# Altium project SMBUS-I2C-sensors-proto.PrjPcb
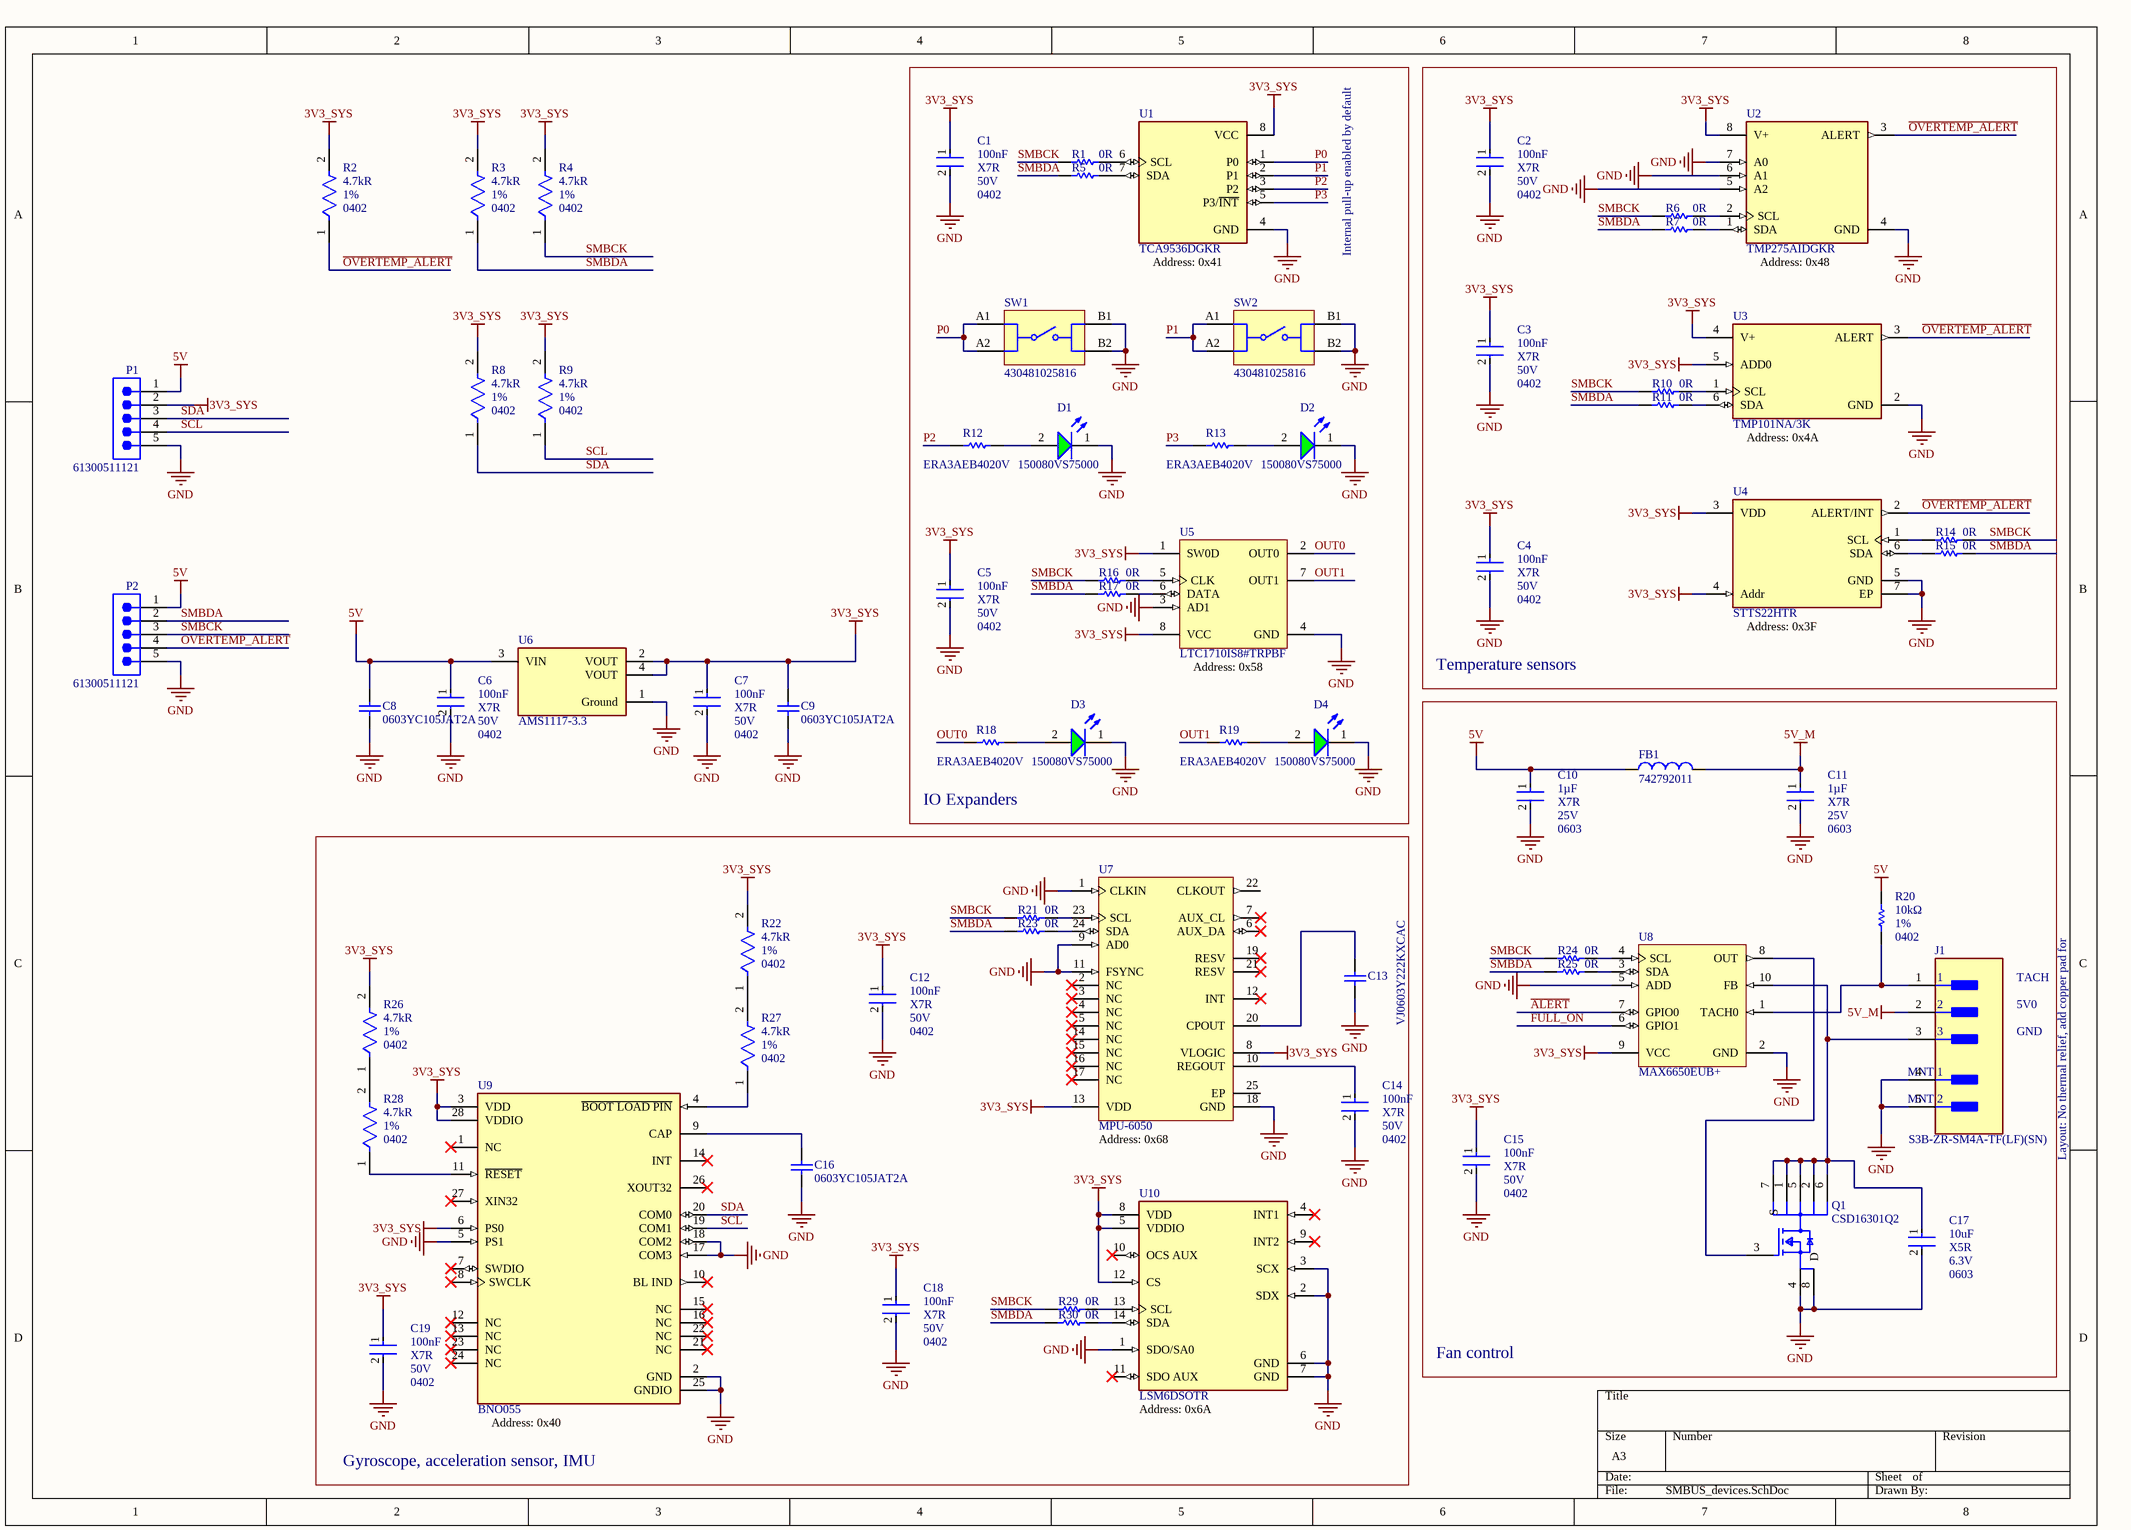
[diagram p0: SMBUS_devices.SchDoc]
1 sheet, 70 parts. Net scope: global (net labels, ports and power ports of the same name join across sheets).
Board file: PCB1.PcbDoc

## Sheet SMBUS_devices.SchDoc
size A3; SheetNumber: 1; SheetTotal: 1

### Parts
C1  Voltage Rating (DC): 50V  Case/Package: 0402  Dielectric: X7R  Capacitance: 100nF  [FP-GRM155-0_05-IPC_B]  (hidden comment: GRM155R71H104KE14D)
C2  Voltage Rating (DC): 50V  Case/Package: 0402  Dielectric: X7R  Capacitance: 100nF  [FP-GRM155-0_05-IPC_B]  (hidden comment: GRM155R71H104KE14D)
C3  Voltage Rating (DC): 50V  Case/Package: 0402  Dielectric: X7R  Capacitance: 100nF  [FP-GRM155-0_05-IPC_B]  (hidden comment: GRM155R71H104KE14D)
C4  Voltage Rating (DC): 50V  Case/Package: 0402  Dielectric: X7R  Capacitance: 100nF  [FP-GRM155-0_05-IPC_B]  (hidden comment: GRM155R71H104KE14D)
C5  Voltage Rating (DC): 50V  Case/Package: 0402  Dielectric: X7R  Capacitance: 100nF  [FP-GRM155-0_05-IPC_B]  (hidden comment: GRM155R71H104KE14D)
C6  Voltage Rating (DC): 50V  Case/Package: 0402  Dielectric: X7R  Capacitance: 100nF  [FP-GRM155-0_05-IPC_B]  (hidden comment: GRM155R71H104KE14D)
C7  Voltage Rating (DC): 50V  Case/Package: 0402  Dielectric: X7R  Capacitance: 100nF  [FP-GRM155-0_05-IPC_B]  (hidden comment: GRM155R71H104KE14D)
C8  0603YC105JAT2A  [CAPC1608X90X35NL15T15]
C9  0603YC105JAT2A  [CAPC1608X90X35NL15T15]
C10  Dielectric: X7R  Capacitance: 1µF  Voltage Rating: 25V  Case/Package: 0603  [FP-GCM188-0_1-MFG]  (hidden comment: GCM188R71E105KA64D)
C11  Dielectric: X7R  Capacitance: 1µF  Voltage Rating: 25V  Case/Package: 0603  [FP-GCM188-0_1-MFG]  (hidden comment: GCM188R71E105KA64D)
C12  Voltage Rating (DC): 50V  Case/Package: 0402  Dielectric: X7R  Capacitance: 100nF  [FP-GRM155-0_05-IPC_B]  (hidden comment: GRM155R71H104KE14D)
C13  VJ0603Y222KXCAC  [CAPC1608X92X38NL15T08]
C14  Voltage Rating (DC): 50V  Case/Package: 0402  Dielectric: X7R  Capacitance: 100nF  [FP-GRM155-0_05-IPC_B]  (hidden comment: GRM155R71H104KE14D)
C15  Voltage Rating (DC): 50V  Case/Package: 0402  Dielectric: X7R  Capacitance: 100nF  [FP-GRM155-0_05-IPC_B]  (hidden comment: GRM155R71H104KE14D)
C16  0603YC105JAT2A  [CAPC1608X90X35NL15T15]
C17  Voltage Rating (DC): 6.3V  Dielectric: X5R  Capacitance: 10uF  Case/Package: 0603  [FP-GRM188-0_1-e0_2_0_55-IPC_A]  (hidden comment: GRM188R60J106ME47D)
C18  Voltage Rating (DC): 50V  Case/Package: 0402  Dielectric: X7R  Capacitance: 100nF  [FP-GRM155-0_05-IPC_B]  (hidden comment: GRM155R71H104KE14D)
C19  Voltage Rating (DC): 50V  Case/Package: 0402  Dielectric: X7R  Capacitance: 100nF  [FP-GRM155-0_05-IPC_B]  (hidden comment: GRM155R71H104KE14D)
D1  150080VS75000  [WL-SMCW_0805_150080xx75000]
D2  150080VS75000  [WL-SMCW_0805_150080xx75000]
D3  150080VS75000  [WL-SMCW_0805_150080xx75000]
D4  150080VS75000  [WL-SMCW_0805_150080xx75000]
FB1  742792011  [WE-CBF_0805_L2W1.2H0.9_HC]
J1  S3B-ZR-SM4A-TF(LF)(SN)  [FP-S3B-ZR-SM4A-TF_LF_SN-MFG]
P1  61300511121  [61300511121]
P2  61300511121  [61300511121]
Q1  CSD16301Q2  [FP-CSD16301Q2-MFG]
R1  value 0R  [RESC1005X40X25NL05T10]  (hidden comment: RC0402JR-100RL)
R2  Case Code (Imperial): 0402  Tolerance: 1%  Resistance: 4.7kR  [FP-CRCW0402-e3-IPC_B]  (hidden comment: CRCW04024K70FKED)
R3  Case Code (Imperial): 0402  Tolerance: 1%  Resistance: 4.7kR  [FP-CRCW0402-e3-IPC_B]  (hidden comment: CRCW04024K70FKED)
R4  Case Code (Imperial): 0402  Tolerance: 1%  Resistance: 4.7kR  [FP-CRCW0402-e3-IPC_B]  (hidden comment: CRCW04024K70FKED)
R5  value 0R  [RESC1005X40X25NL05T10]  (hidden comment: RC0402JR-100RL)
R6  value 0R  [RESC1005X40X25NL05T10]  (hidden comment: RC0402JR-100RL)
R7  value 0R  [RESC1005X40X25NL05T10]  (hidden comment: RC0402JR-100RL)
R8  Case Code (Imperial): 0402  Tolerance: 1%  Resistance: 4.7kR  [FP-CRCW0402-e3-IPC_B]  (hidden comment: CRCW04024K70FKED)
R9  Case Code (Imperial): 0402  Tolerance: 1%  Resistance: 4.7kR  [FP-CRCW0402-e3-IPC_B]  (hidden comment: CRCW04024K70FKED)
R10  value 0R  [RESC1005X40X25NL05T10]  (hidden comment: RC0402JR-100RL)
R11  value 0R  [RESC1005X40X25NL05T10]  (hidden comment: RC0402JR-100RL)
R12  ERA3AEB4020V  [RESC1608X55X30ML20T20]
R13  ERA3AEB4020V  [RESC1608X55X30ML20T20]
R14  value 0R  [RESC1005X40X25NL05T10]  (hidden comment: RC0402JR-100RL)
R15  value 0R  [RESC1005X40X25NL05T10]  (hidden comment: RC0402JR-100RL)
R16  value 0R  [RESC1005X40X25NL05T10]  (hidden comment: RC0402JR-100RL)
R17  value 0R  [RESC1005X40X25NL05T10]  (hidden comment: RC0402JR-100RL)
R18  ERA3AEB4020V  [RESC1608X55X30ML20T20]
R19  ERA3AEB4020V  [RESC1608X55X30ML20T20]
R20  value 10kΩ  Case/Package: 0402  Tolerance: 1%  [RESC1005X40X25LL05T10]  (hidden comment: RC0402FR-0710KL)
R21  value 0R  [RESC1005X40X25NL05T10]  (hidden comment: RC0402JR-100RL)
R22  Case Code (Imperial): 0402  Tolerance: 1%  Resistance: 4.7kR  [FP-CRCW0402-e3-IPC_B]  (hidden comment: CRCW04024K70FKED)
R23  value 0R  [RESC1005X40X25NL05T10]  (hidden comment: RC0402JR-100RL)
R24  value 0R  [RESC1005X40X25NL05T10]  (hidden comment: RC0402JR-100RL)
R25  value 0R  [RESC1005X40X25NL05T10]  (hidden comment: RC0402JR-100RL)
R26  Case Code (Imperial): 0402  Tolerance: 1%  Resistance: 4.7kR  [FP-CRCW0402-e3-IPC_B]  (hidden comment: CRCW04024K70FKED)
R27  Case Code (Imperial): 0402  Tolerance: 1%  Resistance: 4.7kR  [FP-CRCW0402-e3-IPC_B]  (hidden comment: CRCW04024K70FKED)
R28  Case Code (Imperial): 0402  Tolerance: 1%  Resistance: 4.7kR  [FP-CRCW0402-e3-IPC_B]  (hidden comment: CRCW04024K70FKED)
R29  value 0R  [RESC1005X40X25NL05T10]  (hidden comment: RC0402JR-100RL)
R30  value 0R  [RESC1005X40X25NL05T10]  (hidden comment: RC0402JR-100RL)
SW1  430481025816  [430481025816]
SW2  430481025816  [430481025816]
U1  TCA9536DGKR  [SOP65P490X110-8N]
U2  TMP275AIDGKR  [FP-DGK0008A-IPC_C]
U3  TMP101NA/3K  [FP-DBV0006A-IPC_A]
U4  STTS22HTR  [FP-UDFN-6L-DM00423052-MFG]
U5  LTC1710IS8#TRPBF  [LT-S8-8_M]
U6  AMS1117-3.3  [FP-AMS1117-IPC_C]
U7  MPU-6050  [IS-QFN-24_V]
U8  MAX6650EUB+  [MAXM-U10+2_N]
U9  BNO055  [FP-BNO055-MFG]
U10  LSM6DSOTR  [FP-LGA-14L-DM00249496-MFG]

### Blocks framed on the sheet
IO Expanders: C1 C5 D1-D4 R1 R5 R12 R13 R16-R19 SW1 SW2 U1 U5
Temperature sensors: C2-C4 R6 R7 R10 R11 R14 R15 U2-U4
Fan control: C10 C11 C15 C17 FB1 J1 Q1 R20 R24 R25 U8
Gyroscope, acceleration sensor, IMU: C12-C14 C16 C18 C19 R21-R23 R26-R30 U7 U9 U10

### Nets
3V3_SYS: C1.1 C2.1 C3.1 C4.1 C5.1 C7.1 C9.2 C12.1 C15.1 C18.1 C19.1 P1.2 R2.2 R3.2 R4.2 R8.2 R9.2 R22.2 R26.2 U1.8(VCC) U2.8(V+) U3.4(V+) U3.5(ADD0) U4.3(VDD) U4.4(Addr) U5.1(SW0D) U5.8(VCC) U6.2(VOUT) U6.4(VOUT) U7.8(VLOGIC) U7.13(VDD) U8.9(VCC) U9.3(VDD) U9.6(PS0) U9.28(VDDIO) U10.5(VDDIO) U10.8(VDD) U10.12(CS)
5V: C6.1 C8.2 C10.1 FB1.1 P1.1 P2.1 R20.2 U6.3(VIN)
5V_M: C11.1 FB1.2 J1.2
GND: C1.2 C2.2 C3.2 C4.2 C5.2 C6.2 C7.2 C8.1 C9.1 C10.2 C11.2 C12.2 C13.1 C14.2 C15.2 C16.1 C17.2 C18.2 C19.2 D1.1(K) D2.1(K) D3.1(K) D4.1(K) J1.4(MNT_1) J1.5(MNT_2) P1.5 P2.5 Q1.4(S) Q1.8(D) SW1.B1 SW1.B2 SW2.B1 SW2.B2 U1.4(GND) U2.4(GND) U2.5(A2) U2.6(A1) U2.7(A0) U3.2(GND) U4.5(GND) U4.7(EP) U5.3(AD1) U5.4(GND) U6.1(Ground) U7.1(CLKIN) U7.9(AD0) U7.11(FSYNC) U7.18(GND) U8.2(GND) U8.5(ADD) U9.2(GND) U9.5(PS1) U9.17(COM3) U9.18(COM2) U9.25(GNDIO) U10.1(SDO/SA0) U10.2(SDX) U10.3(SCX) U10.6(GND) U10.7(GND)
~{ALERT}: U8.7(GPIO0)
~{FULL_O}N: U8.6(GPIO1)
~{OVERTEMP_ALERT}: P2.4 R2.1 U2.3(ALERT) U3.3(ALERT) U4.2(ALERT/INT)
OUT0: R18.1 U5.2(OUT0)
OUT1: R19.1 U5.7(OUT1)
P0: SW1.A1 SW1.A2 U1.1(P0)
P1: SW2.A1 SW2.A2 U1.2(P1)
P2: R12.1 U1.3(P2)
P3: R13.1 U1.5(P3/~{INT})
SCL: P1.4 R9.1 U9.19(COM1)
SDA: P1.3 R8.1 U9.20(COM0)
SMBCK: P2.3 R1.1 R4.1 R6.1 R10.1 R14.2 R16.1 R21.1 R24.1 R29.1
SMBDA: P2.2 R3.1 R5.1 R7.1 R11.1 R15.2 R17.1 R23.1 R25.1 R30.1
NetC13_2: C13.2 U7.20(CPOUT)
NetC14_1: C14.1 U7.10(REGOUT)
NetC16_2: C16.2 U9.9(CAP)
NetC17_1: C17.1 J1.3 Q1.1(D) Q1.2(D) Q1.5(D) Q1.6(D) Q1.7(S) U8.10(FB)
NetD1_2: D1.2(A) R12.2
NetD2_2: D2.2(A) R13.2
NetD3_2: D3.2(A) R18.2
NetD4_2: D4.2(A) R19.2
NetJ1_1: J1.1 R20.1 U8.1(TACH0)
NetQ1_3: Q1.3(G) U8.8(OUT)
NetR1_2: R1.2 U1.6(SCL)
NetR5_2: R5.2 U1.7(SDA)
NetR6_2: R6.2 U2.2(SCL)
NetR7_2: R7.2 U2.1(SDA)
NetR10_2: R10.2 U3.1(SCL)
NetR11_2: R11.2 U3.6(SDA)
NetR14_1: R14.1 U4.1(SCL)
NetR15_1: R15.1 U4.6(SDA)
NetR16_2: R16.2 U5.5(CLK)
NetR17_2: R17.2 U5.6(DATA)
NetR21_2: R21.2 U7.23(SCL)
NetR22_1: R22.1 R27.2
NetR23_2: R23.2 U7.24(SDA)
NetR24_2: R24.2 U8.4(SCL)
NetR25_2: R25.2 U8.3(SDA)
NetR26_1: R26.1 R28.2
NetR27_1: R27.1 U9.4(~{BOOT_LOAD_PIN})
NetR28_1: R28.1 U9.11(~{RESET})
NetR29_2: R29.2 U10.13(SCL)
NetR30_2: R30.2 U10.14(SDA)

Not connected (* = marked no-connect by the designer): U7 2(NC)* 3(NC)* 4(NC)* 5(NC)* 6(AUX_DA)* 7(AUX_CL)* 12(INT)* 14(NC)* 15(NC)* 16(NC)* 17(NC)* 19(RESV)* 21(RESV)* 22(CLKOUT) 25(EP); U9 1(NC)* 7(SWDIO)* 8(SWCLK)* 10(BL_IND)* 12(NC)* 13(NC)* 14(INT)* 15(NC)* 16(NC)* 21(NC)* 22(NC)* 23(NC)* 24(NC)* 26(XOUT32)* 27(XIN32)*; U10 4(INT1)* 9(INT2)* 10(OCS_AUX)* 11(SDO_AUX)*

### Notes on the sheet
- (near U1) Address: 0x41
- Internal pull-up enabled by default
- (near U2) Address: 0x48
- (near U3) Address: 0x4A
- (near U5) Address: 0x58
- (near U4) Address: 0x3F
- TACH
- 5V0
- GND
- (near U7) Address: 0x68
- Layout: No thermal relief, add copper pad for
- (near U10) Address: 0x6A
- (near U9) Address: 0x40

### Library data of the parts
C1-C7 C12 C14 C15 C18 C19 = CMP-2008-04639-2: Chip Multilayer Ceramic Capacitors for General Purpose, 0402, 0.10uF, X7R, 15%, 10%, 50V; Dissipation Factor: 0.025%; Weight: 0.000212oz; Thickness: 0.022inch; Dielectric Material: Ceramic; Termination: SMD/SMT; Case Code (Imperial): 0402; Mount: Surface Mount; REACH SVHC: No SVHC; Resistor Type: Ceramic; Max Operating Temperature: 125°C; Voltage: 50V; Lead Free: Lead Free; Package Quantity: 10000; Packaging: Tape and Reel; Length: 1mm; Material: Ceramic; Height: 0.5mm; Depth: 0.5mm; Width: 0.5mm; Min Operating Temperature: -55°C; Tolerance: 10%; Case Code (Metric): 1005; Voltage Rating: 50V
C8 C9 C16 = CMP-1035-02736-2: Manufacturer: AVX Interconnect / Elco; Part Number: 0603YC105JAT2A
C10 C11 = CMP-2006-02363-4: Manufacturer Lifecycle Status: IN PRODUCTION; NexarPartId: 18909256; Material: Ceramic; Tolerance: 10%; Thickness: 889µm; Max Operating Temperature: 125°C; Radiation Hardening: No; Weight: 6.293594mg; Lead Free: Lead Free; Mount: Surface Mount; Case Code (Imperial): 0603; REACH SVHC: No SVHC; Lifecycle Status: Production; Depth: 800µm; Min Operating Temperature: -55°C; Height: 800µm; Case Code (Metric): 1608; Voltage: 25V; Packaging: Cut Tape; Length: 1.6mm; Termination: SMD/SMT; Width: 787.4µm; Voltage Rating (DC): 25V; RoHS: Compliant; Schedule B: 8532240020, 8532240020; Ratings: AEC-Q200
C13 = CMP-2006-01127-1: Manufacturer: Vitramon; Part Number: VJ0603Y222KXCAC
C17 = CMP-2006-02792-2: Chip Multilayer Ceramic Capacitors for General Purpose, 0603, 10uF, X5R, 15%, 20%, 6.3V; Packaging: Tape and Reel; Width: 0.031inch; Termination: SMD/SMT; Package Quantity: 4000; Voltage Rating: 6.3V; Min Operating Temperature: -55°C; Voltage: 6.3V; Length: 1.6mm; Thickness: 0.035inch; Lead Free: Lead Free; Depth: 0.8mm; Case Code (Imperial): 0603; Max Operating Temperature: 85°C; Material: Ceramic; Height: 0.8mm; Tolerance: 20%; Mount: Surface Mount; REACH SVHC: No SVHC; Radiation Hardening: No; Case Code (Metric): 1608
D1-D4 = CMP-1426-00009-6: WL-SMCW SMT Mono-Color Chip LED Waterclear; Max Junction Temperature (Tj): 95°C; Max Reverse Voltage (DC): 5V; Luminous Intensity: 40mcd; Color: Green; Peak Wavelength: 572nm; Wavelength: 570nm; Viewing Angle: 140°; Power Dissipation: 72mW; Forward Current: 100mA; Test Current: 20mA; Forward Voltage: 2V; Lens Style: Clear, Rectangular; Reverse Voltage: 5V; Length: 2mm; RoHS: Compliant; Min Operating Temperature: -40°C; REACH SVHC: Unknown; Packaging: Tape and Reel; Case/Package: 0805; Max Operating Temperature: 85°C; Case Code (Metric): 2012; Width: 1.25mm; Dominant Wavelength: 570nm; Mount: Surface Mount; Case Code (Imperial): 0805; Height: 700µm
FB1 = CMP-0220-00043-2: NexarPartId: 22803106; Resistance: 30mΩ; Current Rating: 3A; Impedance: 10Ω; Width: 1.2mm; Length: 2mm; Min Operating Temperature: -55°C; Height: 900µm; Packaging: Cut Tape (CT); RoHS: Compliant; Max Operating Temperature: 125°C
J1 = CMP-17439-000744-1: CONN HEADER SMD R/A 3POS 1.5MM; Number of Contacts: 3; Contact Resistance: 30mR; Gender: Male; Voltage Rating: 50V; Max Current Rating: 1A; Orientation: Right Angle; Flammability Rating: UL94 V-0; Housing Color: Beige; Insulation Material: Nylon; Max Operating Temperature: 85°C; Min Operating Temperature: -25°C; Packaging: Tape and Reel; Contact Shape: Circular; Depth: 6.5mm; Mount: Surface Mount; Insulation Color: Natural; Width: 3.5mm; Number of Rows: 1; Termination: Solder; Color: Natural; Contact Plating: Copper; Contact Type: Male Pin; Pitch: 1.5mm; Length: 7.5mm; Number of Positions: 3; Housing Material: Polyamide; Max Voltage Rating (AC): 50V; Fastening Type: Detent; Lead Free: Lead Free; Series: ZH; Contact Finish - Mating: TIN; Connector Type: Header; Current Rating: 1A; Contact Material: Brass; Height: 7.2mm
P1 P2 = CMP-1502-01068-4: THT Vertical Pin Header WR-PHD, Pitch 2.54 mm, Single Row, 5 pins; Number of Contacts: 5; Connector Type: Male Pin; Operating Supply Voltage: 250V; Contact Resistance: 20mΩ; Gender: Male; Pitch: 2.54mm; Current Rating: 3A; Min Operating Temperature: -40°C; Contact Material: Gold; Color: Black; RoHS: Compliant; Number of Rows: 1; Lead Free: Lead Free; Height: 8.89mm; Contact Plating: Gold; Number of Pins: 5; Orientation: Vertical; Voltage Rating: 250V; Packaging: Bulk; Number of Positions: 5; Max Operating Temperature: 105°C; Termination: Solder; Lead Pitch: 2.54mm; Contact Mating Length: 5.9944mm; Mount: Through Hole
Q1 = CMP-04962-000001-1: MOSFET N-CH 25V 6-SON; Manufacturer: Texas Instruments; Reverse Recovery Charge: 5.1nC; Number Of Channels: 1; Gate To Source Voltage: +10/-8V; Threshold Vgs Min: 0.9V; Pulse Drain Current: 85A; Rthja Max: 65°C/W; Power Dissipation: 2.5W; Turn Off Delay Time: 4.1ns; Drain To Source Resistance: 23mΩ; Turn On Delay Time: 2.7ns; Typ Forward Diode Voltage: 0.8V; Continuous Drain Current: 8.2A; Standoff Height: 0mm; Reverse Recovery Time: 11ns; Gate Charge At Vgs: 2nC @ 4.5V; Max Junction Temp: +150°C; Depletion Mode: False; Transconductance: 16.5S; Threshold Vgs Max: 1.55V; Input Capacitace At Vds: 260pF @ 12.5V; Max Forward Diode Voltage: 1V; Temperature: -55°C to +150°C; Mouser Description: MOSFET N-Channel NexFET Power MOSFET; Octopart: https://octopart.com/csd16301q2-texas+instruments-12088257; Device Class L2: Transistors; Digikey Description: MOSFET N-CH 25V 6-SON; ComponentLink2Description: Datasheet; Drain To Source Voltage: 25V; Height: 0.8mm; Device Class L3: MOSFETs; Temperature Range High: +150°C; Device Class L1: Discrete Semiconductors; Lead Free: Yes; RoHS: TRUE; Temperature Range Low: -55°C; Package: 0; ComponentLink2URL: http://www.ti.com/lit/ds/symlink/csd16301q2.pdf; Drain To Source Breakdown Voltage: 25V; Number Of N Channels: 1; Category: Trans; Automotive: No; Manufacturer Part Number: CSD16301Q2
R1 R5-R7 R10 R11 R14-R17 R21 R23-R25 R29 R30 = CMP-2002-06970-1: Manufacturer: Yageo; Part Number: RC0402JR-100RL
R2-R4 R8 R9 R22 R26-R28 = CMP-2002-00051-3: RES Thick Film, 4.7kΩ, 1%, 0.063W, 100ppm/°C, 0402; Voltage Rating (DC): 50V; Power Rating: 63mW; Termination: SMD/SMT; Military Standard: Not; Length: 1mm; Radiation Hardening: No; Max Operating Temperature: 155°C; Min Operating Temperature: -55°C; Package Quantity: 10; Width: 0.5mm; Number of Terminations: 2; Max Power Dissipation: 63mW; Features: Automotive AEC-Q200; Composition: Thick Film; Depth: 0.5mm; Mount: Surface Mount; Weight: 2.3E-05oz; Lead Free: Lead Free; Case/Package: 0402; Height: 0.35mm; Packaging: Tape and Reel; Temperature Coefficient: 100ppm/°C; Case Code (Metric): 1005; Voltage Rating: 50V; Contact Plating: Tin
R12 R13 R18 R19 = CMP-2000-00056-1: Manufacturer: Panasonic; Part Number: ERA3AEB4020V
R20 = CMP-2002-07353-1: Manufacturer: Yageo / Phycomp; Power Dissipation: 62.5mW; Power Rating: 63mW; Temperature Coefficient: 100ppm/°C; Voltage Rating: 50V; Part Number: RC0402FR-0710KL; Supplier: Farnell; Supplier Part Number: 2421890; Manufacturer Part Number: RC0402FR-0710KL; RoHS: Compliant; Category: Chip SMD Resistors; Stock: 1970000; Case Code (Imperial): 0402; Case Code (Metric): 0402; China RoHS: Non-Compliant; Composition: Thick Film; Depth: 500µm; Height: 350µm; Lead Free: Lead Free; Lead Pitch: 200µm; Length: 1mm; Lifecycle Status: Production; Max Operating Temperature: 155°C; Military Standard: Not; Min Operating Temperature: -55°C; Mounting Technology: Surface Mount; Pins: 2; Number of Terminals: 2; Number of Terminations: 2; Packaging: Tape & Reel; REACH SVHC: Yes; Schedule B: 8533210045, 8533210045|8533210045|8533210045|8533210045|8533210045|8533210045|8533210045|8533210045|8533210045|8533210045|8533210045|8533210045|8533210045|8533210045, 8533210045|8533210045|8533210045|8533210045|8533210045|8533210045|8533210045|8533210045|8533210045|8533210045|8533210045|8533210045|8533210045|8533210045|8533210045, 8533210045|8533210045|8533210045|8533210045|8533210045|8533210045|8533210045|8533210045|8533210045|8533210045|8533210045|8533210045|8533210045|8533210045|8533210045|8533210045; Termination: SMD/SMT; Voltage Rating (DC): 50V; Width: 500µm; Working Voltage: 50V; ComponentLink1URL: https://datasheet.octopart.com:443/RC0402FR-0710KL-Yageo-datasheet-175887523.pdf?src-supplier=Newark; ComponentLink1Description: https://datasheet.octopart.com:443/RC0402FR-0710KL-Yageo-datasheet-175887523.pdf?src-supplier=Newark; ComponentLink2URL: https://datasheet.octopart.com:443/RC0402FR-0710KL-Yageo-datasheet-12531192.pdf?src-supplier=Newark; ComponentLink2Description: https://datasheet.octopart.com:443/RC0402FR-0710KL-Yageo-datasheet-12531192.pdf?src-supplier=Newark; ComponentLink3URL: https://datasheet.octopart.com:443/RC0402FR-0710KL-Yageo-datasheet-8324527.pdf?src-supplier=Newark; ComponentLink3Description: https://datasheet.octopart.com:443/RC0402FR-0710KL-Yageo-datasheet-8324527.pdf?src-supplier=Newark; ComponentLink4URL: https://datasheet.octopart.com:443/RC0402FR-0710KL-Yageo-datasheet-10408619.pdf?src-supplier=element14+APAC; ComponentLink4Description: https://datasheet.octopart.com:443/RC0402FR-0710KL-Yageo-datasheet-10408619.pdf?src-supplier=element14+APAC; ComponentLink5URL: https://datasheet.octopart.com:443/RC0402FR-0710KL-Yageo-datasheet-62067350.pdf?src-supplier=element14+APAC; ComponentLink5Description: https://datasheet.octopart.com:443/RC0402FR-0710KL-Yageo-datasheet-62067350.pdf?src-supplier=element14+APAC; ComponentLink6URL: https://datasheet.octopart.com:443/RC0402FR-0710KL-Yageo-datasheet-21426659.pdf?src-supplier=element14+APAC; ComponentLink6Description: https://datasheet.octopart.com:443/RC0402FR-0710KL-Yageo-datasheet-21426659.pdf?src-supplier=element14+APAC; ComponentLink7URL: https://datasheet.octopart.com:443/RC0402FR-0710KL-Yageo-datasheet-164759695.pdf?src-supplier=Upverter; ComponentLink7Description: https://datasheet.octopart.com:443/RC0402FR-0710KL-Yageo-datasheet-164759695.pdf?src-supplier=Upverter; ComponentLink8URL: https://datasheet.octopart.com:443/RC0402FR-0710KL-Yageo-datasheet-103092701.pdf?src-supplier=Upverter; ComponentLink8Description: https://datasheet.octopart.com:443/RC0402FR-0710KL-Yageo-datasheet-103092701.pdf?src-supplier=Upverter; ComponentLink9URL: https://sigma.octopart.com:443/138820526/technical_drawing/Yageo-RC0402FR-0710KL.pdf?src-supplier=Upverter; ComponentLink9Description: https://sigma.octopart.com:443/138820526/technical_drawing/Yageo-RC0402FR-0710KL.pdf?src-supplier=Upverter; ComponentLink10URL: https://datasheet.octopart.com:443/RC0402FR-0710KL-Yageo-datasheet-98239111.pdf?src-supplier=Upverter; ComponentLink10Description: https://datasheet.octopart.com:443/RC0402FR-0710KL-Yageo-datasheet-98239111.pdf?src-supplier=Upverter; ComponentLink11URL: https://datasheet.octopart.com:443/RC0402FR-0710KL-Yageo-datasheet-68298067.pdf?src-supplier=Upverter; ComponentLink11Description: https://datasheet.octopart.com:443/RC0402FR-0710KL-Yageo-datasheet-68298067.pdf?src-supplier=Upverter; ComponentLink12URL: https://datasheet.octopart.com:443/RC0402FR-0710KL-Yageo-datasheet-68297981.pdf?src-supplier=Upverter; ComponentLink12Description: https://datasheet.octopart.com:443/RC0402FR-0710KL-Yageo-datasheet-68297981.pdf?src-supplier=Upverter; ComponentLink13URL: https://datasheet.octopart.com:443/RC0402FR-0710KL-Yageo-datasheet-141435361.pdf?src-supplier=Upverter; ComponentLink13Description: https://datasheet.octopart.com:443/RC0402FR-0710KL-Yageo-datasheet-141435361.pdf?src-supplier=Upverter; ComponentLink14URL: https://datasheet.octopart.com:443/RC0402FR-0710KL-Yageo-datasheet-12509768.pdf?src-supplier=Upverter; ComponentLink14Description: https://datasheet.octopart.com:443/RC0402FR-0710KL-Yageo-datasheet-12509768.pdf?src-supplier=Upverter; ComponentLink15URL: https://datasheet.octopart.com:443/RC0402FR-0710KL-Yageo-datasheet-8329306.pdf?src-supplier=element14; ComponentLink15Description: https://datasheet.octopart.com:443/RC0402FR-0710KL-Yageo-datasheet-8329306.pdf?src-supplier=element14; ComponentLink16URL: https://datasheet.octopart.com:443/RC0402FR-0710KL-Yageo-datasheet-505231.pdf?src-supplier=element14; ComponentLink16Description: https://datasheet.octopart.com:443/RC0402FR-0710KL-Yageo-datasheet-505231.pdf?src-supplier=element14; ComponentLink17URL: https://datasheet.octopart.com:443/RC0402FR-0710KL-Yageo-datasheet-175423674.pdf?src-supplier=SOS+electronic; ComponentLink17Description: https://datasheet.octopart.com:443/RC0402FR-0710KL-Yageo-datasheet-175423674.pdf?src-supplier=SOS+electronic; ComponentLink18URL: https://datasheet.octopart.com:443/RC0402FR-0710KL-Yageo-datasheet-137700087.pdf?src-supplier=Future+Electronics; ComponentLink18Description: https://datasheet.octopart.com:443/RC0402FR-0710KL-Yageo-datasheet-137700087.pdf?src-supplier=Future+Electronics; ComponentLink19URL: https://datasheet.octopart.com:443/RC0402FR-0710KL-Yageo-datasheet-8324255.pdf?src-supplier=Future+Electronics; ComponentLink19Description: https://datasheet.octopart.com:443/RC0402FR-0710KL-Yageo-datasheet-8324255.pdf?src-supplier=Future+Electronics; ComponentLink20URL: https://datasheet.octopart.com:443/RC0402FR-0710KL-Yageo-datasheet-79472498.pdf?src-supplier=Megastar; ComponentLink20Description: https://datasheet.octopart.com:443/RC0402FR-0710KL-Yageo-datasheet-79472498.pdf?src-supplier=Megastar; ComponentLink21URL: https://datasheet.octopart.com/RC0402FR-0710KL-Yageo-datasheet-73766026.pdf; ComponentLink21Description: https://datasheet.octopart.com/RC0402FR-0710KL-Yageo-datasheet-73766026.pdf; ComponentLink22URL: http://sigma.octopart.com:80/conflict_mineral_statement/Yageo-company-3.pdf?src-supplier=Compliance+Statements; ComponentLink22Description: http://sigma.octopart.com:80/conflict_mineral_statement/Yageo-company-3.pdf?src-supplier=Compliance+Statements; ComponentLink23URL: http://sigma.octopart.com:80/rohs_statement/Yageo-company-2.pdf?src-supplier=Compliance+Statements; ComponentLink23Description: http://sigma.octopart.com:80/rohs_statement/Yageo-company-2.pdf?src-supplier=Compliance+Statements
SW1 SW2 = CMP-1452-00025-9: Switch Tactile Spst-no 0.05A 12V; Actuator Length: 500µm; Current Rating: 50mA; Mechanical Life: 1Mcycles; Switch Function: Off-Mom; Actuator Material: Liquid Crystal Polymer, Polymer; Switch Travel: 250µm; Operating Force: 160N; Insulation Resistance: 100MΩ; Throw Configuration: SPST; Illumination Type: Illuminated, Non-Illuminated; Min Operating Temperature: -40°C; Termination: SMD/SMT; Width: 6.2mm; Length: 6.2mm; Contact Material: Stainless Steel, Steel; Lead Free: Lead Free; Voltage Rating: 12V; Contact Plating: Silver; Mount: Surface Mount; Color: Black; REACH SVHC: No; Max Operating Temperature: 85°C; Packaging: Tape and Reel; Life (Cycles): 1Mcycles; Voltage Rating (DC): 12V; Contact Resistance: 100mΩ; Height: 2.5mm; Contact Current Rating: 50mA; RoHS: Compliant
U1 = TCA9536DGKR: Remote 4-Bit IÂ²C and SMBus I/O expander with configuration register and interrupt; MF: Texas Instruments; SnapEDA_Link: https://www.snapeda.com/parts/TCA9536DGKR/Texas+Instruments/view-part/?ref=snap; Package: None; Value: *; MP: TCA9536DGKR; Check_prices: https://www.snapeda.com/parts/TCA9536DGKR/Texas+Instruments/view-part/?ref=eda
U2 = CMP-04948-000056-1: SENSOR DIGITAL -40C-125C 8VSSOP; Quiescent Current: 50uA; Max Supply Voltage: 5.5V; Nominal Supply Current: 410uA; Interface: I2C; Min Supply Voltage: 2.7V; Number of Bits: 12; Resolution: 12b; Operating Supply Current: 85uA; RoHS Compliant: Yes; Max Operating Temperature: 125°C; Series: -; Output Type: Digital; Number of Pins: 8; Case/Package: VSSOP; Min Operating Temperature: -40°C; Contact Plating: Gold; Supply Current: 410uA; Lead Free: Lead Free; Max Supply Voltage (DC): 5.5V; Min Supply Voltage (DC): 2.7V; REACH SVHC: No SVHC; Package Quantity: 2500; Mount: Surface Mount; Radiation Hardening: No; Packaging: Tape and Reel
U3 = CMP-04948-000039-1: SENSOR DIGITAL -55C-125C SOT23-6; Operating Supply Current: 75uA; Output Current: 4mA; Max Supply Voltage (DC): 5.5V; Number of Bits: 12; Output Type: I2C; Min Supply Voltage (DC): 2.7V; Resolution: 12b; Quiescent Current: 45uA; Package Quantity: 3000; RoHS Compliant: Yes; Max Supply Voltage: 5.5V; Packaging: Tape and Reel; Mount: Surface Mount; Min Supply Voltage: 2.7V; Max Operating Temperature: 125°C; Radiation Hardening: No; Lead Free: Lead Free; Min Operating Temperature: -55°C; Interface: I2C; Series: TMP101; Contact Plating: Gold; Case/Package: SOT-23-6
U4 = CMP-12184-000002-1: LOW-VOLTAGE, ULTRA-LOW-POWER, 0.; Manufacturer: STMicroelectronics; Max Supply Voltage: 3.6V; Sensor Output: I2C,SMBus; Min Supply Voltage: 1.5V; Resolution: 16bits; Standoff Height: 0mm; Operating Supply Current: 1.75-120uA; Octopart: https://octopart.com/stts22htr-stmicroelectronics-103417944; Temperature: -40°C to +125°C; Interface: I2C,SMBus; ComponentLink2Description: Datasheet; Device Class L3: unset; Lead Free: Yes; Temperature Range Low: -40°C; ComponentLink2URL: https://www.st.com/resource/en/datasheet/stts22h.pdf; Temperature Range High: +125°C; RoHS: TRUE; Automotive: No; Device Class L1: Sensors; Category: IC; Manufacturer Part Number: STTS22HTR; Package: UDFN-6L-DM00423052; Device Class L2: Temperature and Humidity Sensors; Mouser Description: Low-voltage, ultra-low-power, 0.5 ï¿½C accuracy Iï¿½C/SMBus 3.0 temperature sensor; Digikey Description: LOW-VOLTAGE, ULTRA-LOW-POWER, 0.; Height: 0.55mm
U5 = CMP-0479-00585-1: Control Up to 6 Peripherals on Same Bus, 2.7 to 5.5 V Vin, 8-pin SOIC (S8-8), -40 to 85 degC, Pb-Free, Tape and Reel; Manufacturer: Linear Technology; RoHS: TRUE; PackageVersion: Rev. G, 03/2012; ComponentLink3Description: Package Specification; Packing: Tape and Reel; ComponentLink3URL: http://cds.linear.com/docs/en/packaging/05081610_G_SO8.pdf; ComponentLink2Description: Datasheet; ComponentLink2URL: http://cds.linear.com/docs/en/datasheet/1710f.pdf; PartNumber: LTC1710IS8#TRPBF; PackageReference: S8-8; ComponentLink1Description: Manufacturer URL; ComponentLink1URL: http://www.linear.com/; PackageDescription: 8-Pin Plastic Small Outline (Narrow .150 Inch), Body 4.9 x 3.9 mm, Pitch 1.27 mm; Mounting Technology: Surface Mount
U6 = CMP-209535-000001-1: LDO Voltage Regulators 1A, 3.3V; Manufacturer: Advanced Monolithic Systems; Dropout Voltage: 1.1V; Output Type: Fixed; Nominal Supply Current: 5mA; Max Power Dissipation: 1.2W; Max Supply Voltage: 15V; Number Of Outputs: 1; Standoff Height: 0.64mm; Max Junction Temp: +125°C; Height: 1.8mm; Package: AMS1117; Device Class L2: Power Management ICs; ComponentLink2Description: Datasheet; ComponentLink2URL: http://www.advanced-monolithic.com/pdf/ds1117.pdf; Category: IC; RoHS: TRUE; Automotive: No; Device Class L1: Integrated Circuits (ICs); Output Current: 1A; Device Class L3: Voltage Regulators - Linear; Temperature: -40°C to +125°C; Output Voltage: 3.3V; Manufacturer Part Number: AMS1117-3.3; Temperature Range Low: -40°C; Octopart: https://octopart.com/ams1117-3.3-advanced+monolithic+systems-25899300; Lead Free: Yes; Ipc Land Pattern Name: SOT229P700X180-4; Temperature Range High: +125°C
U7 = CMP-1753-00002-2: 3-Axis Gyroscope, Accelerometer and a Digital Motion Processor(TM) (DMP), 2.375 to 3.46 V, -40 to 85 degC, 24-Pin QFN, RoHS, Tape and Reel; Manufacturer: InvenSense; Featured Product: MPU-60506-Axis,IntegratedI²CSolution; Other Names: 1428-1007-2 / MPU6050; Sensor Type: MotionTracking; Online Catalog: MPU-6000™Series; Unit PriceUSD: Digital; Datasheet Version: Rev. 3.3, 05/2012; Category: Sensors,Transducers; Datasheet URL: http://datasheet.octopart.com/MPU-6050-InvenSense-datasheet-14421344.pdf; Family: Multifunction; Standard Package: 5,000; Manufacturer URL: http://www.invensense.com/; Output Type: Digital; Dynamic Catalog: MPU-6000™Series
U8 = CMP-0253-00590-1: Fan-Speed Regulator and Monitor with I2C / SMBus Interface, -40 to 85 degC, 10-Pin SOP (U10+2), Pb-Free; Interface: 2-Wire/I2C/SMBus; Fan Cntrl.: Linear; PackageDescription: 10-Pin Micro-MAX, Thin Shrink Small-Outline (U10+2), Body 3 x 3 mm, Pitch 0.5 mm; ComponentLink2Description: Datasheet; ComponentLink3Description: Package Specification; PackageVersion: Rev. L, 07/2008; ComponentLink3URL: http://pdfserv.maximintegrated.com/package_dwgs/21-0061.PDF; PartNumber: MAX6650EUB+; ComponentLink1URL: http://www.maximintegrated.com/; Code_JEDEC: MO-187; Generic Part Number: MAX6650; PackageReference: U10+2; Mounting Technology: Surface Mount; DatasheetVersion: Rev. 4; ComponentLink2URL: http://datasheets.maximintegrated.com/en/ds/MAX6650-MAX6651.pdf; ComponentLink1Description: Manufacturer URL
U9 = CMP-2000-05075-4: IMU ACCEL/GYRO/MAG I2C 28LGA; Sensor Type: Accelerometer; Packaging: Tape and Reel; Case/Package: LGA; Min Operating Temperature: -40°C; Mount: Surface Mount; Output Type: I2C; Lead Free: Lead Free; Max Operating Temperature: 85°C
U10 = CMP-12177-000012-1: CONSUMER MEMS; Manufacturer: STMicroelectronics; Gyro Range: 125/250/500/1000/2000°/s; Max Supply Voltage: 3.6V; Sensor Output: I2C,SPI; Operating Supply Current: 0.55mA; Accel Range: 2/4/8/16g; Min Supply Voltage: 1.62V; Sensor Type: Temperature,Accelerometer,Gyroscope; Height: 0.86mm; Automotive: No; Device Class L3: Inertial Measurement Units (IMUs); Device Class L1: Sensors; ComponentLink2Description: Datasheet; Device Class L2: Motion Sensors; Temperature: -40°C to +85°C; Package: LGA-14L-DM00249496; Octopart: https://octopart.com/lsm6dsotr-stmicroelectronics-81706672; Temperature Range Low: -40°C; Digikey Description: CONSUMER MEMS; ComponentLink2URL: https://www.st.com/resource/en/datasheet/lsm6dso.pdf; Manufacturer Part Number: LSM6DSOTR; Mouser Description: iNEMO inertial module: "always-on" integrated 3D accelerometer and 3D gyroscope; Footprint Url: https://www.st.com/content/ccc/resource/technical/document/technical_note/73/17/9c/16/dd/96/4a/01/CD00134799.pdf/files/CD00134799.pdf/jcr:content/translations/en.CD00134799.pdf; Lead Free: Yes; RoHS: TRUE; Category: IC; Temperature Range High: +85°C